# Altium schematic sheet 01_POWER_DIAGRAM.SchDoc
size 420 x 297 mm; SheetNumber: 2; SheetTotal: 3
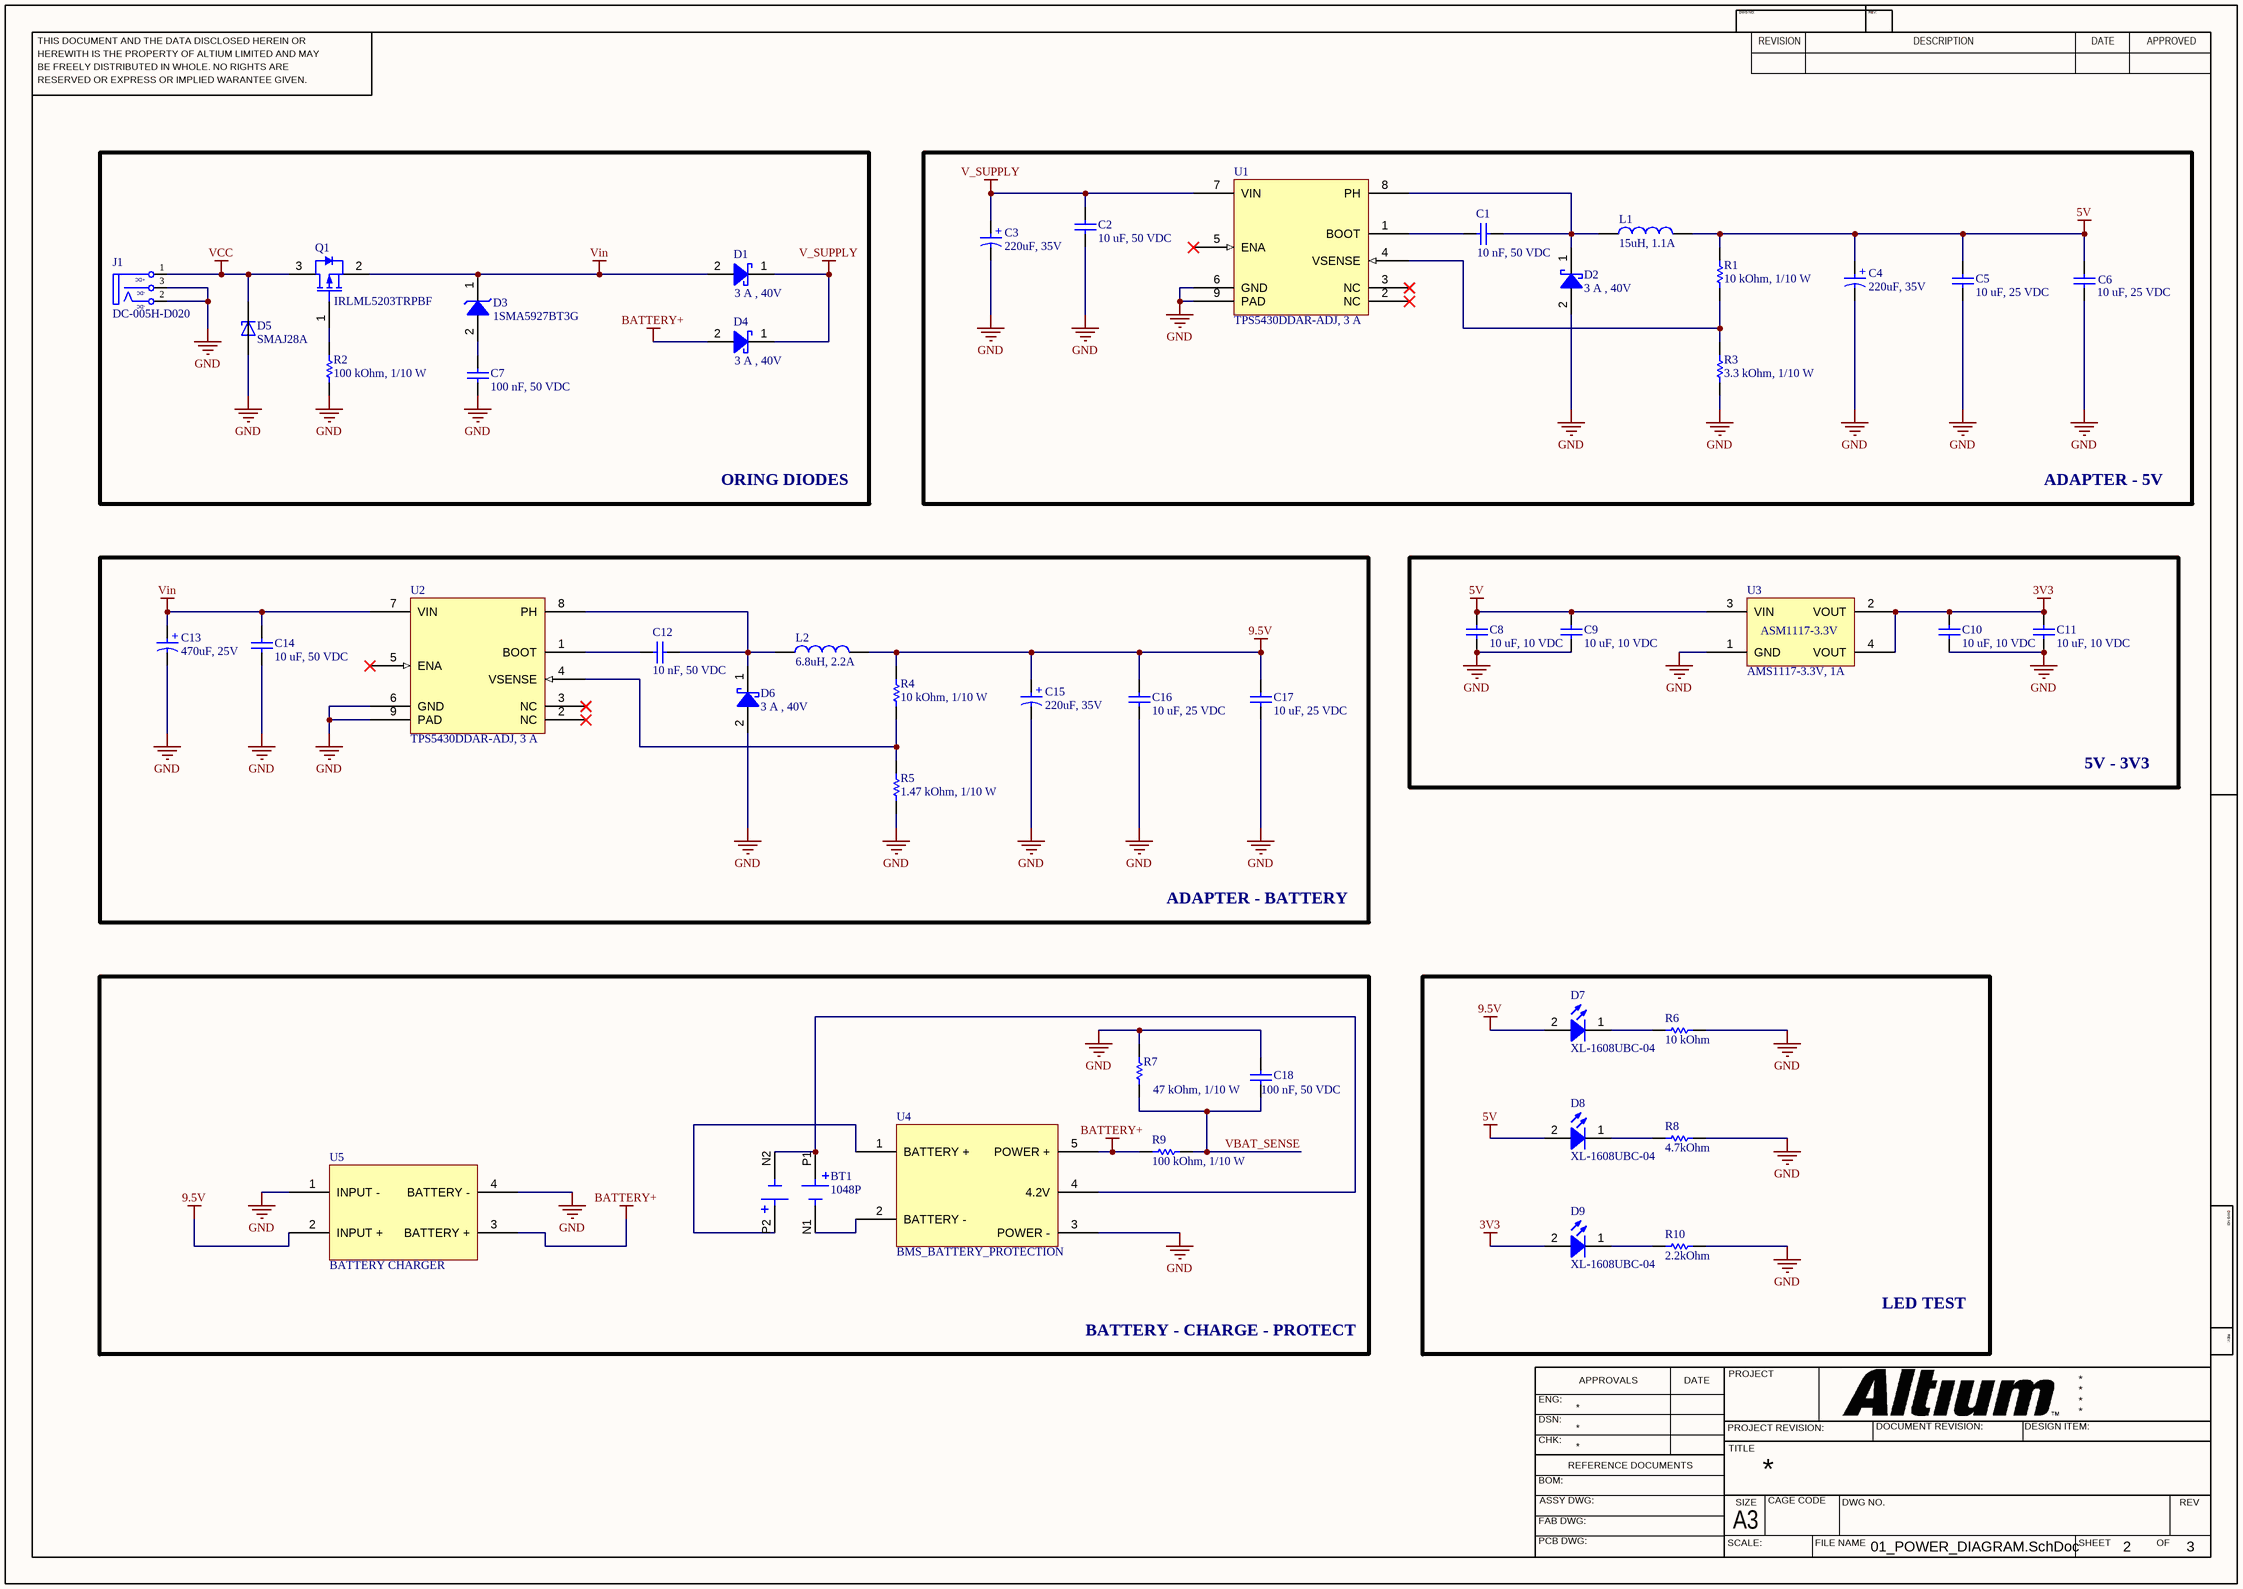
[diagram p0: 01_POWER_DIAGRAM.SchDoc]

## Parts
BT1  1048P  [BAT_1048P]
C1  10 nF, 50 VDC  [CAP_0603]
C2  10 uF, 50 VDC  [CAP_0603]
C3  220uF, 35V  [WCAP-ASLI_D8H10.5]
C4  220uF, 35V  [WCAP-ASLI_D8H10.5]
C5  10 uF, 25 VDC  [CAP_0603]
C6  10 uF, 25 VDC  [CAP_0603]
C7  100 nF, 50 VDC  [CAP_0603]
C8  10 uF, 10 VDC  [CAP_0603]
C9  10 uF, 10 VDC  [CAP_0603]
C10  10 uF, 10 VDC  [CAP_0603]
C11  10 uF, 10 VDC  [CAP_0603]
C12  10 nF, 50 VDC  [CAP_0603]
C13  470uF, 25V  [WCAP-ASLI_D10H10.5]
C14  10 uF, 50 VDC  [CAP_0603]
C15  220uF, 35V  [WCAP-ASLI_D8H10.5]
C16  10 uF, 25 VDC  [CAP_0603]
C17  10 uF, 25 VDC  [CAP_0603]
C18  100 nF, 50 VDC  [CAP_0603]
D1  3 A , 40V  [SMA (DO-214AC)]
D2  3 A , 40V  [SMA (DO-214AC)]
D3  1SMA5927BT3G  [SMA (DO-214AC)]
D4  3 A , 40V  [SMA (DO-214AC)]
D5  SMAJ28A  [DIOM4325X250N]
D6  3 A , 40V  [SMA (DO-214AC)]
D7  XL-1608UBC-04  [WL-SMCW_0603_H=0.7mm]
D8  XL-1608UBC-04  [WL-SMCW_0603_H=0.7mm]
D9  XL-1608UBC-04  [WL-SMCW_0603_H=0.7mm]
J1  DC-005H-D020  [DC-005H-D020]
L1  15uH, 1.1A  [WE-PD2A_5D28]
L2  6.8uH, 2.2A  [WE-PD2A_5848]
Q1  IRLML5203TRPBF  [IRLML5203TRPBF]
R1  10 kOhm, 1/10 W  [RES_0603]
R2  100 kOhm, 1/10 W  [RES_0603]
R3  3.3 kOhm, 1/10 W  [RES_0603]
R4  10 kOhm, 1/10 W  [RES_0603]
R5  1.47 kOhm, 1/10 W  [RES_0603]
R6  10 kOhm  [RES_0603]
R7  47 kOhm, 1/10 W  [RES_0603]
R8  4.7kOhm  [RES_0603]
R9  100 kOhm, 1/10 W  [RES_0603]
R10  2.2kOhm  [RES_0603]
U1  TPS5430DDAR-ADJ, 3 A  [TPS5430DDAR]
U2  TPS5430DDAR-ADJ, 3 A  [TPS5430DDAR]
U3  AMS1117-3.3V, 1A  [AMS1117-3.3V SOT223]
U4  BMS_BATTERY_PROTECTION  [BMS_BATTERY_PROTECTION]
U5  BATTERY CHARGER  [TP5100_BATTERY_CHARGER]

## Blocks framed on the sheet
ORING DIODES: C7 D1 D3-D5 J1 Q1 R2
ADAPTER - 5V: C1-C6 D2 L1 R1 R3 U1
ADAPTER - BATTERY: C12-C17 D6 L2 R4 R5 U2
5V - 3V3: C8-C11 U3
BATTERY - CHARGE - PROTECT: BT1 C18 R7 R9 U4 U5
LED TEST: D7-D9 R6 R8 R10

## Nets
3V3: C10.2 C11.2 D9.2(A) U3.2(VOUT) U3.4(VOUT)
5V: C4.1(P) C5.2 C6.2 C8.2 C9.2 D8.2(A) L1.2 R1.2 U3.3(VIN)
9.5V: C15.1(P) C16.2 C17.2 D7.2(A) L2.2 R4.2 U5.2(INPUT_+)
BATTERY+: D4.2(A) R9.2 U4.5(POWER_+) U5.3(BATTERY_+)
GND: C2.1 C3.2(N) C4.2(N) C5.1 C6.1 C7.1 C8.1 C9.1 C10.1 C11.1 C13.2(N) C14.1 C15.2(N) C16.1 C17.1 C18.1 D2.2(A) D5.A D6.2(A) J1.2(TN) J1.3(S) R2.1 R3.1 R5.1 R6.2 R7.2 R8.2 R10.2 U1.6(GND) U1.9(PAD) U2.6(GND) U2.9(PAD) U3.1(GND) U4.3(POWER_-) U5.1(INPUT_-) U5.4(BATTERY_-)
V_SUPPLY: C2.2 C3.1(P) D1.1(K) D4.1(K) U1.7(VIN)
VCC: D5.C J1.1(T) Q1.3(D)
Vin: C13.1(P) C14.2 D1.2(A) D3.1(K) Q1.2(S) U2.7(VIN)
VBAT_SENSE: C18.2 R7.1 R9.1
NetBT1_N1: BT1.N1 U4.2(BATTERY_-)
NetBT1_N2: BT1.N2 BT1.P1 U4.4(4.2V)
NetBT1_P2: BT1.P2 U4.1(BATTERY_+)
NetC1_1: C1.1 D2.1(K) L1.1 U1.8(PH)
NetC1_2: C1.2 U1.1(BOOT)
NetC7_2: C7.2 D3.2(A)
NetC12_1: C12.1 D6.1(K) L2.1 U2.8(PH)
NetC12_2: C12.2 U2.1(BOOT)
NetD7_1: D7.1(K) R6.1
NetD8_1: D8.1(K) R8.1
NetD9_1: D9.1(K) R10.1
NetQ1_1: Q1.1(G) R2.2
NetR1_1: R1.1 R3.2 U1.4(VSENSE)
NetR4_1: R4.1 R5.2 U2.4(VSENSE)

Not connected (* = marked no-connect by the designer): U1 2(NC)* 3(NC)* 5(ENA)*; U2 2(NC)* 3(NC)* 5(ENA)*

## Notes on the sheet
- THIS DOCUMENT AND THE DATA DISCLOSED HEREIN OR
- HEREWITH IS THE PROPERTY OF ALTIUM LIMITED AND MAY
- DWG NO:
- REVISION
- REV:
- DESCRIPTION
- DATE
- APPROVED
- BE FREELY DISTRIBUTED IN WHOLE. NO RIGHTS ARE
- RESERVED OR EXPRESS OR IMPLIED WARANTEE GIVEN.
- ENG:
- APPROVALS
- PROJECT
- DSN:
- CHK:
- REFERENCE DOCUMENTS
- PROJECT REVISION:
- TITLE
- DOCUMENT REVISION:
- DESIGN ITEM:
- BOM:
- FAB DWG:
- PCB DWG:
- ASSY DWG:
- SCALE:
- A3
- SIZE
- CAGE CODE
- FILE NAME
- DWG NO.
- SHEET
- OF
- REV
- (in symbol 865080457015) +
- (in symbol 865080553014) +
- (in symbol AMS1117-3.3V) ASM1117-3.3V
- (in symbol DC-005H-D020) +DC; -DC

## Library data of the parts
BT1 = 1048P: SMT Polarized Holder for Dual 18650 Batteries; MF: Keystone Electronics; Value: *; MP: 1048P; Price: None; Package: None; Availability: In Stock; SnapEDA_Link: https://www.snapeda.com/parts/1048P/Keystone+Electronics/view-part/?ref=snap; Purchase-URL: https://pricing.snapeda.com/search/part/1048P/?ref=eda; Check_prices: https://www.snapeda.com/parts/1048P/Keystone+Electronics/view-part/?ref=eda
C1 C12 = 0106031030550: CAP, size 0603, 10 nF, 50 VDC, 5%; Manufacturer: TDK; Manufacturer Part Number: CGA3E2C0G1H103J080AE; Capacitance: 10 nF; Tolerance: +/-5%; Voltage Rating DC: 50 VDC; Value: 10 nF; Packaging: Tape and Reel; Supplier 1 URL: https://www.mouser.com/ProductDetail/TDK/CGA3E2C0G1H103J080AE?qs=P1JMDcb91o6ZkMITrWTUZQ%3D%3D&utm_source=mouser-refine-download&utm_medium=file&utm_campaign=CGA3E2C0G1H103J080AE&utm_content=TDK; Supplier 2 URL: https://www.digikey.com/en/products/detail/tdk-corporation/cga3e2c0g1h103j080ae/11697946; Supplier 3 URL: N/A; Supplier 1: Mouser; Supplier 1 Part Number: 810-CGA3E2C0G1H103J8; Supplier 2: Digi-Key; Supplier 2 Part Number: 445-CGA3E2C0G1H103J080AETR-ND; Supplier 3: thegioiic; Supplier 3 Part Number: N/A; ComponentLink1Description: Datasheet; ComponentLink1URL: https://product.tdk.com/system/files/dam/doc/product/capacitor/ceramic/mlcc/catalog/mlcc_automotive_soft_en.pdf?ref_disty=mouser; Mount: SMD/SMT; Operating Temperature Max: + 85 C; Operating Temperature Min: - 40 C; Package / Case: 0603; LCSC Part #: N/A
C2 C8-C11 C14 C16 C17 = 0106031061010: CAP, size 0603, 10 uF, 10 VDC, 10%; Manufacturer: Samsung Electro-Mechanics; Manufacturer Part Number: CL10A106KP8NNNC; Capacitance: 10 uF; Tolerance: +/-10%; Voltage Rating DC: 10 VDC; Value: 10 uF; Packaging: Tape and Reel; Supplier 1 URL: https://www.mouser.vn/ProductDetail/Samsung-Electro-Mechanics/CL10A106KP8NNNC?qs=X6jEic%2FHinAlyfRHj7fKwg%3D%3D; Supplier 2 URL: https://www.digikey.com/en/products/detail/samsung-electro-mechanics/cl10a106kp8nnnc/3886850; Supplier 3 URL: https://www.thegioiic.com/tu-gom-0603-10uf-25v; Supplier 1: Mouser; Supplier 1 Part Number: 187-CL10A106KP8NNNC; Supplier 2: Digi-Key; Supplier 2 Part Number: 1276-1192-2-ND; Supplier 3: thegioiic; Supplier 3 Part Number: N/A; ComponentLink1Description: Datasheet; ComponentLink1URL: https://www.mouser.vn/datasheet/2/585/MLCC-1837944.pdf; Mount: SMD/SMT; Operating Temperature Max: + 85 C; Operating Temperature Min: - 40 C; Package / Case: 0603; LCSC Part #: C19702
C3 C4 C15 = 865080553014: V-Chip, D8 x H10.5mm, 220uF, 35V; Manufacturer: Wurth Elektronik; Capacitance Tolerance: +/-20%; Dissipation Factor: 14%; Endurance: 2000h; Leakage Current: 77uA; Ripple Current: 570mA; Category: Aluminum Electrolytic Capacitors; Mount: Surface Mount; Operating Temperature Max: 105°C; Operating Temperature Min: -55°C; Packaging: Tape and Reel; Height: 10.5mm; Diameter: 8mm; Capacitance: 220uF; Rated Voltage (DC): 35V; Supplier 1 URL: https://www.mouser.com/ProductDetail/Wurth-Elektronik/865080553014?qs=0KOYDY2FL28pPfJzYTQdnQ%3D%3D; Manufacturer Part Number: N/A; Supplier 2 URL: N/A; Supplier 3 URL: N/A; Value: 220uF, 35V; Supplier 1: Mouser; Supplier 1 Part Number: 710-865080553014; Supplier 2: Digi-Key; Supplier 2 Part Number: N/A; Supplier 3: thegioiic; Supplier 3 Part Number: N/A; ComponentLink1Description: Datasheet; ComponentLink1URL: https://www.we-online.com/redexpert/spec/865080553014?ad; LCSC Part #: N/A
C5 C6 = 0106031062025: CAP, size 0603, 10 uF, 25 VDC, 20%; Manufacturer: Samsung Electro-Mechanics; Manufacturer Part Number: CL10A106MA8NRNC; Capacitance: 10 uF; Tolerance: +/-20%; Voltage Rating DC: 25 VDC; Value: 10 uF; Packaging: Tape and Reel; Supplier 1 URL: https://www.mouser.vn/ProductDetail/Samsung-Electro-Mechanics/CL10A106MA8NRNC?qs=47mY1nHWefS2vFRvRJVTdQ%3D%3D; Supplier 2 URL: https://www.digikey.com/en/products/detail/samsung-electro-mechanics/CL10A106MA8NRNC/3887527?s=N4IgTCBcDaIMIBkCMAGAgqgbAWTQDgDkAlAuEAXQF8g; Supplier 3 URL: https://www.thegioiic.com/tu-gom-0603-10uf-25v; Supplier 1: Mouser; Supplier 1 Part Number: 187-CL10A106MA8NRNC; Supplier 2: Digi-Key; Supplier 2 Part Number: 1276-1869-2-ND; Supplier 3: thegioiic; Supplier 3 Part Number: N/A; ComponentLink1Description: Datasheet; ComponentLink1URL: https://www.mouser.vn/datasheet/2/585/MLCC-1837944.pdf; Mount: SMD/SMT; Operating Temperature Max: + 85 C; Operating Temperature Min: - 40 C; Package / Case: 0603; LCSC Part #: C96446
C7 C18 = 0106031041050: CAP, size 0603, 100 nF, 50 VDC, 10%; Manufacturer: TDK; Manufacturer Part Number: CGA3E3X8R1H104K080AE; Capacitance: 100 nF; Tolerance: +/-10%; Voltage Rating DC: 50 VDC; Value: 100 nF; Packaging: Tape and Reel; Supplier 1 URL: https://www.mouser.com/ProductDetail/TDK/CGA3E3X8R1H104K080AE?qs=nQSIdc08i%252Bd8g3IRRgU2bw%3D%3D&utm_source=mouser-refine-download&utm_medium=file&utm_campaign=CGA3E3X8R1H104K080AE&utm_content=TDK; Supplier 2 URL: https://www.digikey.com/en/products/detail/tdk-corporation/cga3e3x8r1h104k080ae/5809262; Supplier 3 URL: https://www.thegioiic.com/tu-gom-0603-100nf-0-1uf-50v; Supplier 1: Mouser; Supplier 1 Part Number: 810-CGA3E3X8R1H104KA; Supplier 2: Digi-Key; Supplier 2 Part Number: 445-173697-2-ND; Supplier 3: thegioiic; Supplier 3 Part Number: N/A; ComponentLink1Description: Datasheet; ComponentLink1URL: https://product.tdk.com/system/files/dam/doc/product/capacitor/ceramic/mlcc/catalog/mlcc_automotive_soft_en.pdf?ref_disty=mouser; Mount: SMD/SMT; Operating Temperature Max: + 85 C; Operating Temperature Min: - 40 C; Package / Case: 0603; LCSC Part #: C14663
C13 = 865080457015: V-Chip, D10 x H10.5mm, 470uF, 25V; Manufacturer: Wurth Elektronik; Capacitance Tolerance: +/-20%; Dissipation Factor: 14%; Endurance: 2000h; Leakage Current: 117.5uA; Ripple Current: 650mA; Category: Aluminum Electrolytic Capacitors; Mount: Surface Mount; Operating Temperature Max: 105°C; Operating Temperature Min: -55°C; Packaging: Tape and Reel; Height: 10.5mm; Diameter: 10mm; Capacitance: 470uF; Rated Voltage (DC): 25V; Supplier 3 URL: https://www.thegioiic.com/tu-nhom-smd-470uf-25v-10x10-5mm; Supplier 1 URL: https://www.mouser.com/ProductDetail/Wurth-Elektronik/865080457015?qs=0KOYDY2FL2%252BEKTJa1jxjAQ%3D%3D; Manufacturer Part Number: N/A; Supplier 2 URL: N/A; Value: 470uF, 25V; Supplier 1: Mouser; Supplier 1 Part Number: 710-865080457015; Supplier 2: Digi-Key; Supplier 2 Part Number: N/A; Supplier 3: thegioiic; Supplier 3 Part Number: N/A; ComponentLink1Description: Datasheet; ComponentLink1URL: https://www.we-online.com/redexpert/spec/865080457015?ad; LCSC Part #: N/A
D1 D2 D4 D6 = SS26: Schottky Diodes & Rectifiers 2.0 Amp 60 Volt 40 Amp IFSM; Manufacturer: Vishay Semiconductors; Manufacturer Part Number: SS26S-E3/5AT; Forward Current: 2 A; Forward Voltage: 750 mV; Max Surge Current: 40 A; Peak Reverse Voltage: 60 V; Reverse Current: 200 uA; Type: Schottky; Supplier 1 URL: https://www.mouser.vn/ProductDetail/Vishay-General-Semiconductor/SS26S-E3-5AT?qs=tWM4QuTcS4UlRJgxN3V1tg%3D%3D; Supplier 2 URL: https://www.digikey.com/en/products/detail/vishay-general-semiconductor-diodes-division/ss26s-e3-5at/2148827; Supplier 3 URL: https://www.thegioiic.com/ss26-smb-diode-schottky-2a; Value: 3 A , 40V; Maximum Diode Capacitance: N/A; Power Dissipation: N/A; Recovery Time: N/A; Supplier 1: Mouser; Supplier 1 Part Number: 625-SS26S-E3/5AT; Supplier 2: Digi-Key; Supplier 2 Part Number: SS26S-E3/5ATGITR-ND; Supplier 3: thegioiic; Supplier 3 Part Number: SS26; Mount: SMD/SMT; Operating Temperature Max: + 85 C; Operating Temperature Min: - 40 C; Package / Case: SMA (DO-214AC); Packaging: Tape and Reel; ComponentLink1Description: Datasheet; ComponentLink1URL: https://www.vishay.com/doc?89055; LCSC Part #: C5350986
D3 = 1SMA5927BT3G: Zener Diodes 12V 1.5W; Manufacturer: onsemi; Zener Current: 125 mA; Power Dissipation: 500 mW; Reverse Current: 500 nA; Voltage Tolerance: 5 %; Zener Impedance: 30 Ohms; Type: Zener; Supplier 1 URL: https://www.mouser.vn/ProductDetail/onsemi/1SMA5927BT3G?qs=y2kkmE52mdMhTuIaEBFoKA%3D%3D; Supplier 2 URL: N/A; Supplier 3 URL: N/A; Value: 1SMA5927BT3G; Maximum Reverse Leakage Current: 500 nA; Zener Voltage: 12 V; Manufacturer Part Number: 1SMA5927BT3G; Supplier 1: Mouser; Supplier 1 Part Number: 863-1SMA5927BT3G; Supplier 2: Digi-Key; Supplier 2 Part Number: N/A; Supplier 3: thegioiic; Supplier 3 Part Number: N/A; Mount: SMD/SMT; Operating Temperature Max: + 150 C; Operating Temperature Min: - 55 C; Package / Case: SMA; Packaging: Tape and Reel; ComponentLink1Description: Datasheet; ComponentLink1URL: https://www.onsemi.com/PowerSolutions/product.do?id=1SMA5927BT3G; LCSC Part #: C33754
D5 = SMAJ28A: 400W, 32.8V, 5%, Unidirectional, TVS; MF: Taiwan Semiconductor; SnapEDA_Link: https://www.snapeda.com/parts/SMAJ28A/taiwan/view-part/?ref=snap; Package: SMA-2 Taiwan Semiconductor; Value: *; MP: SMAJ28A; Check_prices: https://www.snapeda.com/parts/SMAJ28A/taiwan/view-part/?ref=eda
D7-D9 = XL-1608UBC-04: Blue 470nm LED Indication - Discrete 3.3V 0603; Manufacturer: XINGLIGHT; Type: Clear; Color: Blue; ComponentLink1Description: Datasheet; ComponentLink1URL: https://www.lcsc.com/datasheet/C965807.pdf; Supplier 1 URL: N/A; Supplier 2 URL: N/A; Supplier 3 URL: https://www.thegioiic.com/led-xanh-duong-0603-dan-smd-trong-suot; Value: XL-1608UBC-04; Manufacturer Part Number: XL-1608UBC-04; Mount: SMD/SMT; Operating Temperature Max: + 85 C; Operating Temperature Min: - 40 C; Package / Case: 0603; Packaging: Tape and Reel; Supplier 1: Mouser; Supplier 1 Part Number: N/A; Supplier 2: Digi-Key; Supplier 2 Part Number: N/A; Supplier 3: thegioiic; Supplier 3 Part Number: N/A; LCSC Part #: C965807
J1 = DC-005H-D020: Power Barrel Connector Jack 2mm ID 5.8mm OD Through Hole, Right Angle; Manufacturer: G-Switch; Rated Current: 7A; Voltage Rating DC: 35V; ComponentLink1Description: Datasheet link; ComponentLink1URL: https://www.lcsc.com/datasheet/C5155559.pdf; Manufacturer Part Number: DC-005H-D020; Mount: THT; Number of Pins: 3; Operating Temperature Max: +85 C; Operating Temperature Min: -40 C; Packaging: Through Hole; Supplier 1 URL: N/A; Supplier 2 URL: N/A; Supplier 3 URL: N/A; Value: DC-005H-D020; LCSC Part #: C5155559; Supplier 1: Mouser; Supplier 1 Part Number: N/A; Supplier 2: Digi-Key; Supplier 2 Part Number: N/A; Supplier 3: thegioiic; Supplier 3 Part Number: N/A
L1 = 784774116: WE-PD2A SMT Power Inductor, size 5832, 15uH, 1.53A; Manufacturer Part Number: 784774115; Manufacturer: Wurth Elektronik; DC Resistance max.: 0.14Ohm; Saturation Current: 1.9A; Self Resonant Frequency: 20MHz; DC Resistance typ.: 0.089Ohm; Rated Voltage: 80VDC; ComponentLink1Description: Datasheet; ComponentLink1URL: https://www.we-online.com/catalog/datasheet/784774156.pdf; Published Date: May 2020; Rated Current: 1.53A; Inductance: 15uH; Operating Temperature: -40 to +125degC; Packaging: Tape and Reel; Size: 5848; Supplier 2 URL: https://www.digikey.com/en/products/detail/w%C3%BCrth-elektronik/784774115/5168867?s=N4IgTCBcDaIOwA4Asc5IIzoKwgLoF8g; Supplier 1 URL: https://www.mouser.vn/ProductDetail/Wurth-Elektronik/784774115?qs=sBf%2Fb4nBSleoo7TtqR8SIg%3D%3D; Supplier 3 URL: https://www.thegioiic.com/cuon-cam-dan-smd-cd53-5852-150-15uh-1-7a; Value: 15uH, 1.1A; LCSC Part #: N/A; Mount: SMD/SMT; Supplier 1: Mouser; Supplier 1 Part Number: 710-784774115; Supplier 2: Digi-Key; Supplier 2 Part Number: 732-6832-2-ND; Supplier 3: thegioiic; Supplier 3 Part Number: N/A
L2 = 784774068: WE-PD2A SMT Power Inductor, size 5848, 6.8uH, 2.4A; Manufacturer: Wurth Elektronik; DC Resistance max.: 0.082Ohm; Saturation Current: 5A; Self Resonant Frequency: 28MHz; DC Resistance typ.: 0.071Ohm; Rated Voltage: 80VDC; ComponentLink1Description: Datasheet; ComponentLink1URL: https://www.we-online.com/catalog/datasheet/784774156.pdf; Manufacturer Part Number: 784774068; Published Date: May 2020; Rated Current: 2.4A; Inductance: 6.8uH; Operating Temperature: -40 to +125degC; Packaging: Tape and Reel; Size: 5848; Supplier 2 URL: https://www.digikey.com/en/products/detail/w%C3%BCrth-elektronik/784774068/5168865?s=N4IgTCBcDaIOwA4Asc5IAwDYEgLoF8g; Supplier 1 URL: https://www.mouser.vn/ProductDetail/Wurth-Elektronik/784774068?qs=sBf%2Fb4nBSlfEjoZazogbYQ%3D%3D; Supplier 3 URL: https://www.thegioiic.com/cuon-cam-dan-smd-cd53-5852-6r8-6-8uh-2-2a; Value: 6.8uH, 2.2A; LCSC Part #: N/A; Mount: SMD/SMT; Supplier 1: Mouser; Supplier 1 Part Number: 710-784774068; Supplier 2: Digi-Key; Supplier 2 Part Number: 732-6829-2-ND; Supplier 3: thegioiic; Supplier 3 Part Number: N/A
Q1 = IRLML5203TRPBF: MOSFET MOSFT P-Ch -30V -3A 98mOhm 9.5nC Log Lvl; Manufacturer: Infineon Technologies; Gate Threshold Voltage (Vth): -4 V; Gate-to-Source Voltage (VGS): ±20V; Drain-to-Source On-Resistance: 165 mOhms; Power Dissipation: 1.25 W; FET Type: P-Channel; Drain to Source Voltage (Vdss): -30 V; Continuous Drain Current: -3 A; Total Gate Charge: 9.5 nC; ComponentLink1Description: Datasheet; ComponentLink1URL: https://www.mouser.com/datasheet/2/196/Infineon_IRLML5203_DataSheet_v01_01_EN-3363405.pdf; Supplier 1 URL: https://www.mouser.com/ProductDetail/Infineon-Technologies/IRLML5203TRPBF?qs=9%252BKlkBgLFf2C8TWZ3Ajzqg%3D%3D; Supplier 2 URL: N/A; Supplier 3 URL: N/A; Value: IRLML5203TRPBF; Manufacturer Part Number: IRLML5203TRPBF; Mount: SMD/SMT; Operating Temperature Max: + 150 C; Operating Temperature Min: - 55 C; Package / Case: SOT-23-3; Packaging: Tape and Reel; Supplier 1: Mouser; Supplier 1 Part Number: 942-IRLML5203TRPBF; Supplier 2: Digi-Key; Supplier 2 Part Number: N/A; Supplier 3: thegioiic; Supplier 3 Part Number: N/A; LCSC Part #: C2592
R1 R4 = 0006031031: RES, size 0603, 10 kOhm, 1/10 W, 1%; Manufacturer: YAGEO; Manufacturer Part Number: RC0603FR-0710KL; Resistance: 10 kOhm; Rated Power: 1/10 W; Value: 10 kOhm; Tolerance: +/-1%; Supplier 1 URL: N/A; Supplier 3 URL: https://www.thegioiic.com/dien-tro-10-kohm-0603-1-; Supplier 2 URL: https://www.digikey.com/en/products/detail/yageo/rc0603fr-0710kl/726880; Packaging: Tape and Reel; Supplier 1: Mouser; Supplier 1 Part Number: N/A; Supplier 2: Digi-Key; Supplier 2 Part Number: 311-10.0KHRTR-ND; Supplier 3: thegioiic; Supplier 3 Part Number: N/A; ComponentLink1Description: Datasheet; ComponentLink1URL: https://fscdn.rohm.com/en/products/databook/datasheet/passive/resistor/chip_resistor/esr-e.pdf; Mount: SMD/SMT; Operating Temperature Max: + 85 C; Operating Temperature Min: - 40 C; Package / Case: 0603; LCSC Part #: C98220
R2 = 0006031045: RES, size 0603, 100 kOhm, 1/10 W, 5%; Manufacturer: YAGEO; Manufacturer Part Number: RC0603JR-07100KL; Rated Power: 1/10 W; Tolerance: +/-5%; Resistance: 100 kOhm; Supplier 1 URL: https://www.mouser.vn/ProductDetail/YAGEO/RC0603JR-07100KL?qs=2cAdsCoAWRG9Rhqklpdeqg%3D%3D; Supplier 3 URL: https://www.thegioiic.com/dien-tro-100-kohm-0603-5; Value: 100 kOhm; Supplier 2 URL: https://www.digikey.com/en/products/detail/yageo/rc0603jr-07100kl/726698; Packaging: Tape and Reel; Supplier 1: Mouser; Supplier 1 Part Number: 603-RC0603JR-07100KL; Supplier 2: Digi-Key; Supplier 2 Part Number: 311-100KGRTR-ND; Supplier 3: thegioiic; Supplier 3 Part Number: OEM; ComponentLink1Description: Datasheet; ComponentLink1URL: https://www.mouser.vn/datasheet/2/447/YAGEO_PYu_RC_Group_51_RoHS_L_12-3313492.pdf; Mount: SMD/SMT; Operating Temperature Max: + 85 C; Operating Temperature Min: - 40 C; Package / Case: 0603; LCSC Part #: C100048
R3 R5 = 0006033321: RES, size 0603, 3.3 kOhm, 1/10 W, 1%; Manufacturer: YAGEO; Manufacturer Part Number: RC0603FR-073K3L; Rated Power: 1/10 W; Tolerance: +/-1%; Resistance: 3.3 kOhm; Supplier 1 URL: https://www.mouser.vn/ProductDetail/YAGEO/RC0603FR-073K3L?qs=gt6vzsuosg2EoNiKbtAsfQ%3D%3D; Supplier 3 URL: https://www.thegioiic.com/dien-tro-3-3-kohm-0603-1-; Value: 3.3 kOhm; Supplier 2 URL: https://www.digikey.com/en/products/detail/yageo/rc0603fr-073k3l/727126; Packaging: Tape and Reel; Supplier 1: Mouser; Supplier 1 Part Number: 603-RC0603FR-073K3L; Supplier 2: Digi-Key; Supplier 2 Part Number: 311-3.30KHRTR-ND; Supplier 3: thegioiic; Supplier 3 Part Number: N/A; ComponentLink1Description: Datasheet; ComponentLink1URL: https://api.pim.na.industrial.panasonic.com/file_stream/main/fileversion/4484; Mount: SMD/SMT; Operating Temperature Max: + 85 C; Operating Temperature Min: - 40 C; Package / Case: 0603; LCSC Part #: C108078
R6 R8 R10 = 0006033011: RES, size 0603, 300 Ohm, 1/10 W, 1%; Manufacturer: OEM; Rated Power: 1/10 W; Resistance: 300 Ohm; Value: 300 Ohm; Tolerance: +/-1%; Supplier 1 URL: https://www.mouser.vn/ProductDetail/ROHM-Semiconductor/SDR03EZPF3000?qs=MyNHzdoqoQKYsGXohuNk8Q%3D%3D; Supplier 3 URL: N/A; Supplier 2 URL: https://www.digikey.com/en/products/detail/yageo/RC0603FR-10300RL/14008461; Packaging: Tape and Reel; Supplier 1: Mouser; Supplier 1 Part Number: 755-SDR03EZPF3000; Supplier 2: Digi-Key; Supplier 2 Part Number: 13-RC0603FR-10300RLTR-ND; Supplier 3: thegioiic; Supplier 3 Part Number: N/A; Manufacturer Part Number: OEM; ComponentLink1Description: Datasheet; ComponentLink1URL: N/A; Mount: SMD/SMT; Operating Temperature Max: + 85 C; Operating Temperature Min: - 40 C; Package / Case: 0603; LCSC Part #: N/A
R7 = 0006034731: RES, size 0603, 47 kOhm, 1/10 W, 1%; Manufacturer: YAGEO; Manufacturer Part Number: RC0603FR-0747KL; Resistance: 47 kOhm; Rated Power: 1/10 W; Value: 47 kOhm; Tolerance: +/-1%; Supplier 1 URL: https://www.mouser.com/ProductDetail/YAGEO/RC0603FR-0747KL?qs=gt6vzsuosg3jXzmCiDCCdg%3D%3D; Supplier 3 URL: N/A; Supplier 2 URL: https://www.digikey.com/en/products/detail/yageo/rc0603fr-0747kl/727253; Packaging: Tape and Reel; Supplier 1: Mouser; Supplier 1 Part Number: 603-RC0603FR-0747KL; Supplier 2: Digi-Key; Supplier 2 Part Number: 311-47.0KHRTR-ND; Supplier 3: thegioiic; Supplier 3 Part Number: N/A; ComponentLink1Description: Datasheet; ComponentLink1URL: https://www.mouser.com/datasheet/2/447/YAGEO_PYu_RC_Group_51_RoHS_L_12-3313492.pdf; Mount: SMD/SMT; Operating Temperature Max: + 155 C; Operating Temperature Min: - 55 C; Package / Case: 0603; LCSC Part #: C105579
R9 = 0006031041: RES, size 0603, 100 kOhm, 1/10 W, 1%; Manufacturer: YAGEO; Manufacturer Part Number: RC0603FR-07100KL; Rated Power: 1/10 W; Tolerance: +/-1%; Resistance: 100 kOhm; Supplier 1 URL: https://www.mouser.vn/ProductDetail/YAGEO/RC0603FR-07100KL?qs=e1ok2LiJcmaihem8Va5%2Fsw%3D%3D; Supplier 3 URL: https://www.thegioiic.com/dien-tro-100-kohm-0603-1-; Value: 100 kOhm; Supplier 2 URL: https://www.digikey.com/en/products/detail/yageo/rc0603fr-07100kl/726889; Packaging: Tape and Reel; Supplier 1: Mouser; Supplier 1 Part Number: 603-RC0603FR-07100KL; Supplier 2: Digi-Key; Supplier 2 Part Number: 311-100KHRTR-ND; Supplier 3: thegioiic; Supplier 3 Part Number: 100 KOhm 0603 1% (UNI-ROYALOHM); ComponentLink1Description: Datasheet; ComponentLink1URL: https://www.mouser.vn/datasheet/2/447/YAGEO_PYu_RC_Group_51_RoHS_L_12-3313492.pdf; Mount: SMD/SMT; Operating Temperature Max: + 85 C; Operating Temperature Min: - 40 C; Package / Case: 0603; LCSC Part #: C14675
U1 U2 = TPS5430DDAR: 5.5V to 36V Input, 3A, 500kHz Step-Down Converter; Manufacturer: Texas Instruments; Number of Outputs: 1; Voltage Output: 1.22V - 32V; Package / Case: WSON-10; Output Current: 3 A; Supplier 1 URL: https://www.mouser.com/ProductDetail/Texas-Instruments/TPS5430DDAR?qs=zwk82MlA57ZJdOTovH1aYA%3D%3D; Supplier 2 URL: https://www.digikey.com/en/products/detail/texas-instruments/tps5430ddar/1671816; Supplier 3 URL: https://www.thegioiic.com/tps5430dda-ic-dieu-chinh-giam-ap-3a-8-soic; Value: TPS5430DDAR-ADJ, 3 A; Voltage Input Maximum: 36V; Voltage Input Minimum: 5.5V; Switching Frequency: 500 kHz; Manufacturer Part Number: TPS5430DDAR; Mount: SMD/SMT; Operating Temperature Max: + 85 C; Operating Temperature Min: - 40 C; Packaging: Tape and Reel; Supplier 1: Mouser; Supplier 1 Part Number: 595-TPS5430DDAR; Supplier 2: Digi-Key; Supplier 2 Part Number: 296-26988-2-ND; Supplier 3: thegioiic; Supplier 3 Part Number: TPS5430DDA; ComponentLink1Description: Datasheet; ComponentLink1URL: https://www.ti.com/lit/gpn/TPS5430; LCSC Part #: C9864
U3 = AMS1117-3.3V: 1A 60dB@(120Hz) Fixed 3.3V Positive electrode 12V SOT-223 Linear Voltage Regulators (LDO) ROHS; Manufacturer: AMS; Pad Count: 4; Voltage Input Maximum: 15V; Manufacturer Part Number: N/A; Current Input Maximum: N/A; Current Output Maximum: 1A; Voltage Output: 3.3V; Supplier 1 URL: N/A; Supplier 2 URL: N/A; Supplier 3 URL: https://www.thegioiic.com/ams1117-3-3v-ic-on-ap-3-3v-1a-sot-223; Value: AMS1117-3.3V, 1A; Mount: SMD/SMT; Operating Temperature Max: + 85 C; Operating Temperature Min: - 40 C; Packaging: Tape and Reel; Supplier 1: Mouser; Supplier 1 Part Number: N/A; Supplier 2: Digi-Key; Supplier 2 Part Number: N/A; Supplier 3: thegioiic; Supplier 3 Part Number: N/A; ComponentLink1Description: Datasheet; ComponentLink1URL: http://www.advanced-monolithic.com/pdf/ds1117.pdf; LCSC Part #: C347222
U5 = TP5100_MODULE